# Altium schematic sheet sematik.SchDoc
size A4; SheetNumber: 1; SheetTotal: 1
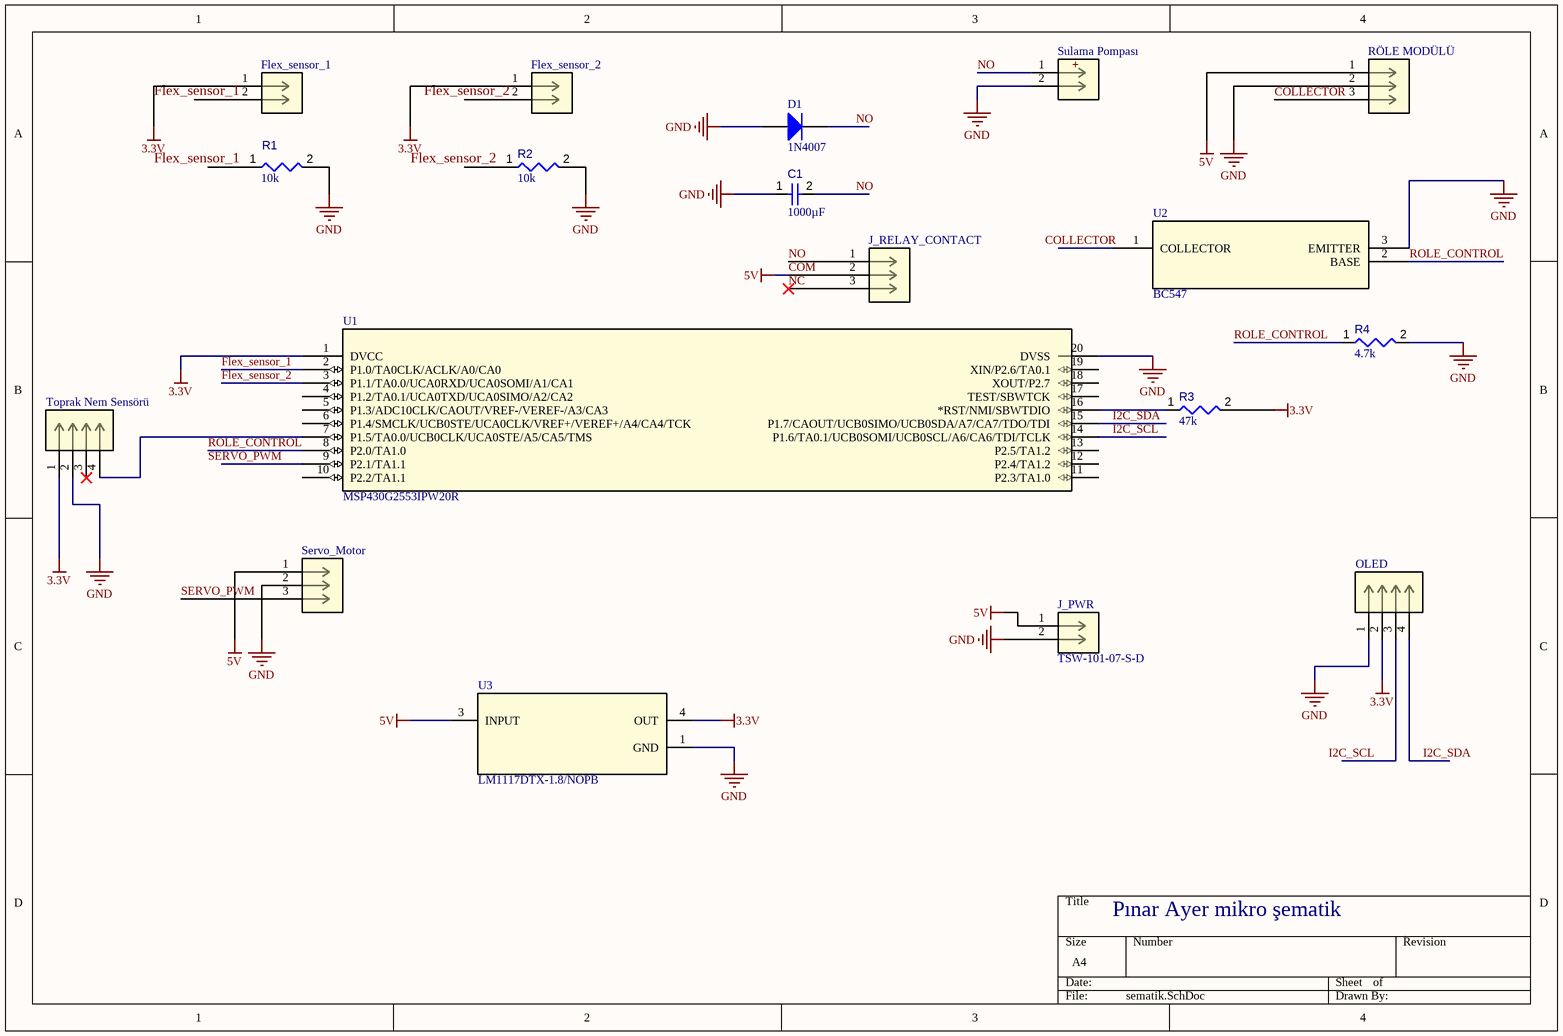
[diagram p0: sematik.SchDoc]

## Parts
C1  value 1000µF  [CAPC0805(2012)145_L]  (hidden comment: Capacitor 47µF +/-40% 6.3V 0805)
D1  1N4007  [FAIR-DO-41-2]
Flex_sensor_1  (no value)  [CON2_2X1_TU_TSW_SAI]
Flex_sensor_2  (no value)  [CON2_2X1_TU_TSW_SAI]
J_PWR  TSW-101-07-S-D  [CON2_2X1_TU_TSW_SAI]
J_RELAY_CONTACT  (no value)  [CONN_SDA-3099-x3xx_PEG_MOL]
OLED  (no value)  [CONN_103414-2_TYCO]
R1  value 10k  [RESC3216X60X45ML15T20]  (hidden comment: Resistor 10k +/-1% 1206 250 mW)
R2  value 10k  [RESC3216X60X45ML15T20]  (hidden comment: Resistor 10k +/-1% 1206 250 mW)
R3  value 47k  [RESC3216X60X45ML15T20]  (hidden comment: Resistor 10k +/-1% 1206 250 mW)
R4  value 4.7k  [RESC2013X70X40ML20T20]  (hidden comment: Resistor 4k7 +/-1% 0805 125 mW)
RÖLE_MODÜLÜ  (no value)  [CONN_SDA-3099-x3xx_PEG_MOL]
Servo_Motor  (no value)  [CONN_SDA-3099-x3xx_PEG_MOL]
Sulama_Pompası  (no value)  [CON2_2X1_TU_TSW_SAI]
Toprak_Nem_Sensörü  (no value)  [CONN_103414-2_TYCO]
U1  MSP430G2553IPW20R  [PW20]
U2  BC547  [TO-92-3_ONS]
U3  LM1117DTX-1.8/NOPB  [NDP0003B]

## Nets
3.3V: OLED.2 Toprak_Nem_Sensörü.1 U1.1(DVCC) U3.4(OUT)
COM: U3.3(INPUT)  [also labelled 5V]
GND: C1.1 D1.2(A) OLED.1 R4.2 Sulama_Pompası.2 Toprak_Nem_Sensörü.2 U1.20(DVSS) U2.3(EMITTER) U3.1(GND)
Flex_sensor_1: U1.2(P1.0/TA0CLK/ACLK/A0/CA0)
Flex_sensor_2: U1.3(P1.1/TA0.0/UCA0RXD/UCA0SOMI/A1/CA1)
I2C_SCL: U1.14(P1.6/TA0.1/UCB0SOMI/UCB0SCL/A6/CA6/TDI/TCLK)
I2C_SDA: OLED.4 U1.15(P1.7/CAOUT/UCB0SIMO/UCB0SDA/A7/CA7/TDO/TDI)
NO: C1.2 D1.1(K) Sulama_Pompası.1
ROLE_CONTROL: R4.1 U1.8(P2.0/TA1.0) U2.2(BASE)
NetR3_1: R3.1 U1.16(*RST/NMI/SBWTDIO)
NetToprak_Nem_Sensörü_4: Toprak_Nem_Sensörü.4 U1.7(P1.5/TA0.0/UCB0CLK/UCA0STE/A5/CA5/TMS)

Not connected (* = marked no-connect by the designer): Flex_sensor_1 1 2; Flex_sensor_2 1 2; J_PWR 1 2; J_RELAY_CONTACT 1 2 3; OLED 3; R1 1 2; R2 1 2; R3 2; RÖLE_MODÜLÜ 1 2 3; Servo_Motor 1 2 3; Toprak_Nem_Sensörü 3*; U1 4(P1.2/TA0.1/UCA0TXD/UCA0SIMO/A2/CA2) 5(P1.3/ADC10CLK/CAOUT/VREF-/VEREF-/A3/CA3) 6(P1.4/SMCLK/UCB0STE/UCA0CLK/VREF+/VEREF+/A4/CA4/TCK) 9(P2.1/TA1.1) 10(P2.2/TA1.1) 11(P2.3/TA1.0) 12(P2.4/TA1.2) 13(P2.5/TA1.2) 17(TEST/SBWTCK) 18(XOUT/P2.7) 19(XIN/P2.6/TA0.1); U2 1(COLLECTOR)

## Notes on the sheet
- Pınar Ayer mikro şematik
- Labels drawn without touching a wire or pin: 3.3V, 5V, +, COLLECTOR, Flex_sensor_1, Flex_sensor_2, GND, I2C_SCL, NC, NO, SERVO_PWM

## Library data of the parts
C1 = CMP-001-00082-4: Chip Capacitor, 47µF +/-40%, 6.3V, 0805, Thickness 1.45 mm; Tolerance: 10%; Min Operating Temperature: -55°C; Max Operating Temperature: 85°C; Case/Package: 0805; Pins: 2; Mounting Technology: SMT; Voltage Rating: 6.3V
D1 = CMP-004-00007-2: General Purpose Rectifier, 1.1 V, 1.0 A, -55 to 175 degC, 2-Pin DO-41, RoHS, Tape and Reel; Manufacturer: Fairchild; Peak Reverse Current: 5uA; Max Surge Current: 30A; Elements: 1; Forward Voltage: 1.1V; Package Version: Rev. 2, 09/2008; Forward Current: 1A; Package Quantity: 5000; Packaging: TapeandReel; Package URL: http://www.fairchildsemi.com/dwg/DO/DO41A.pdf; Manufacturer URL: https://www.fairchildsemi.com/; Package Reference: DO-41-2; Pins: 2; Min Operating Temperature: -55°C; Datasheet Version: Rev. 1.1.0, 11/2014; Max Operating Temperature: 175°C; RoHS Compliant: True; Case/Package: DO-41-2; Mounting Technology: TH; Package Description: 2-Pin Axial Lead, Dia 2.375 mm, Body Length 4.63 mm; Datasheet URL: https://www.fairchildsemi.com/datasheets/1N/1N4007.pdf
Flex_sensor_1 Flex_sensor_2 J_PWR Sulama_Pompası = TSW-101-07-S-D: Description; Manufacturer_Name: Samtec Inc; Copyright: Copyright (C) 2026 Ultra Librarian. All rights reserved.; Manufacturer_Part_Number: TSW-101-07-S-D; RefDes: RefDes; Type: Type
J_RELAY_CONTACT RÖLE_MODÜLÜ Servo_Motor = 10181032: 2.36mm Diameter Standard .093 Pin and Socket Header, Shrouded, 3 Circuits, 3 Male Terminals; Manufacturer_Name: Molex Connector Corporation; Copyright: Copyright (C) 2026 Ultra Librarian. All rights reserved.; Manufacturer_Part_Number: 10181032; RefDes: RefDes; Type: Type
OLED Toprak_Nem_Sensörü = 103414-2: 04 MODII HDR SRST SHRD .100CL; Manufacturer_Name: TE Connectivity; Copyright: Copyright (C) 2026 Ultra Librarian. All rights reserved.; Manufacturer_Part_Number: 103414-2; RefDes: RefDes; Type: Type
R1-R3 = CMP-009-00016-5: Chip Resistor, 10 KOhm, +/- 1%, 0.25 W, -55 to 155 degC, 1206 (3216 Metric); Power: 250mW; Voltage Rating: 200V; Pins: 2; Max Operating Temperature: 155°C; Tolerance: 1%; RoHS Compliant: True; Case/Package: 1206; Min Operating Temperature: -55°C; Mounting Technology: SM
R4 = CMP-009-00032-5: Chip Resistor, 4.7 KOhm, +/- 1%, 0.125 W, -55 to 155 degC, 0805 (2012 Metric); Power: 125mW; Voltage Rating: 150V; Max Operating Temperature: 155°C; Min Operating Temperature: -55°C; Case/Package: 0805; RoHS Compliant: True; Pins: 2; Tolerance: 1%; Mounting Technology: SM
U1 = MSP430G2553IPW20R: 16 MHz MCU with 16KB Flash, 512B SRAM, comparator, UART/SPI/I2C, timer 20-TSSOP -40 to 85; Manufacturer_Name: Texas Instruments; Copyright: Copyright (C) 2025 Ultra Librarian. All rights reserved.; Manufacturer_Part_Number: MSP430G2553IPW20R; RefDes: RefDes; Type: Type
U2 = BC547: Description; Manufacturer_Name: onsemi; Copyright: Copyright (C) 2026 Ultra Librarian. All rights reserved.; Manufacturer_Part_Number: BC547; RefDes: RefDes; Type: Type
U3 = LM1117DTX-1.8NOPB: 800-mA 15-V linear voltage regulator 3-TO-252 0 to 125; Manufacturer_Name: Texas Instruments; TYPE: TYPE; RefDes: RefDes; Copyright: Copyright (C) 2025 Ultra Librarian. All rights reserved.; Manufacturer_Part_Number: LM1117DTX-1.8/NOPB